# Altium schematic sheet MAIN_SCHEMATIC.SchDoc
size A4; SheetNumber: 1; SheetTotal: 9
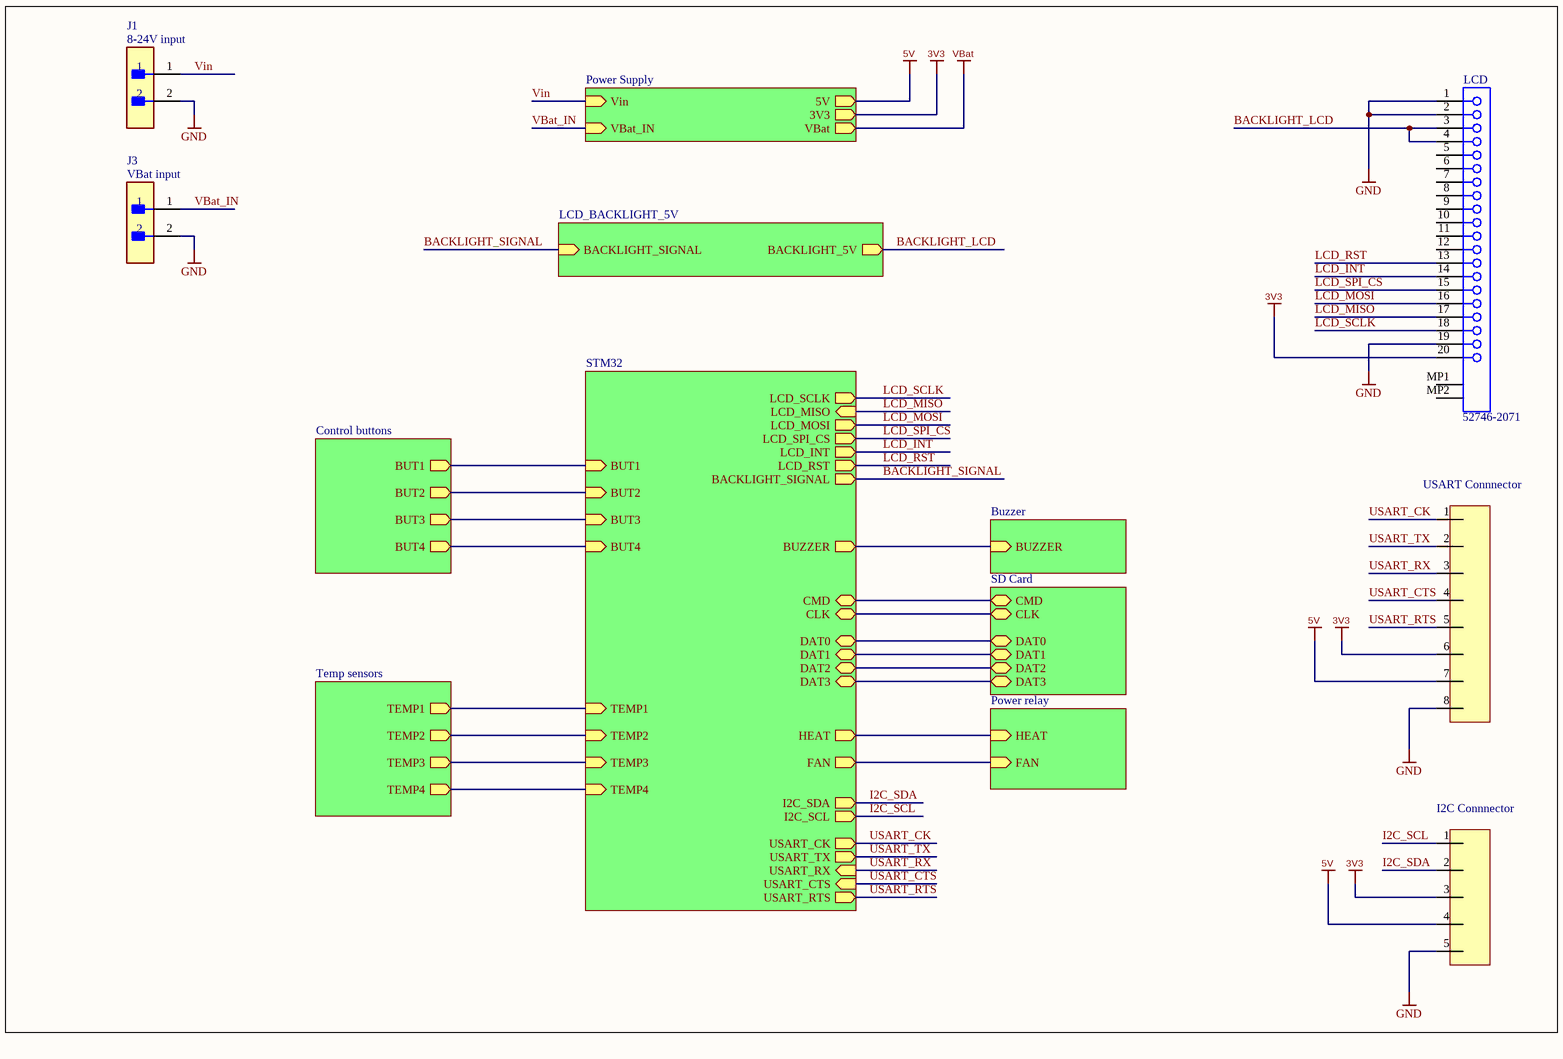
[diagram p0: MAIN_SCHEMATIC.SchDoc]

## Parts
J1  B2B-XH-A(LF)(SN)  [FP-B2B-XH-A_LF_SN-MFG]  (value not drawn)
J2  52746-2071  [MOLX-52746-2071]
J3  B2B-XH-A(LF)(SN)  [FP-B2B-XH-A_LF_SN-MFG]  (value not drawn)
J4  NSL254M-8G  [NSL254M-8G]  (value not drawn)
J5  NSL254M-5G  [NSL254M-5G]  (value not drawn)

## Sub-sheets
Buzzer = BUZZER.SchDoc: BUZZER (in)
Control buttons = BUTTONS.SchDoc: BUT1 (out), BUT2 (out), BUT3 (out), BUT4 (out)
LCD_BACKLIGHT_5V = 3V3_5V_LEVEL_SHIFTER.SchDoc: BACKLIGHT_SIGNAL (in), BACKLIGHT_5V (out)
Power relay = SR40A.SchDoc: HEAT (in), FAN (in)
Power Supply = POWER_SUPPLY.SchDoc: Vin (in), 5V (out), 3V3 (out), VBat (out), VBat_IN (in)
SD Card = SD_CARD.SchDoc: CMD (bidir), CLK (bidir), DAT0 (bidir), DAT1 (bidir), DAT2 (bidir), DAT3 (bidir)
STM32 = STM32: BUT1 (in), BUT2 (in), BUT3 (in), BUT4 (in), TEMP1 (in), TEMP2 (in), TEMP3 (in), TEMP4 (in), HEAT (out), FAN (out), CMD (bidir), CLK (bidir), DAT0 (bidir), DAT1 (bidir), DAT2 (bidir), DAT3 (bidir), BUZZER (out), LCD_SCLK (out), LCD_MISO (in), LCD_MOSI (out), LCD_SPI_CS (out), LCD_INT (out), LCD_RST (out), BACKLIGHT_SIGNAL (out), I2C_SDA (out), I2C_SCL (out), USART_CK (out), USART_TX (out), USART_RX (in), USART_RTS (out), USART_CTS (in)
Temp sensors = PT1000.SchDoc: TEMP1 (out), TEMP2 (out), TEMP3 (out), TEMP4 (out)

## Nets
3V3: J2.20 J4.6 J5.3 ; sheet Power Supply/3V3
5V: J4.7 J5.4 ; sheet Power Supply/5V
GND: J1.2 J2.1 J2.2 J2.19 J3.2 J4.8 J5.5
VBat: sheet Power Supply/VBat
BACKLIGHT_LCD: J2.3 J2.4 ; sheet LCD_BACKLIGHT_5V/BACKLIGHT_5V
BACKLIGHT_SIGNAL: sheet STM32/BACKLIGHT_SIGNAL, sheet LCD_BACKLIGHT_5V/BACKLIGHT_SIGNAL
I2C_SCL: J5.1 ; sheet STM32/I2C_SCL
I2C_SDA: J5.2 ; sheet STM32/I2C_SDA
LCD_INT: J2.14 ; sheet STM32/LCD_INT
LCD_MISO: J2.17 ; sheet STM32/LCD_MISO
LCD_MOSI: J2.16 ; sheet STM32/LCD_MOSI
LCD_RST: J2.13 ; sheet STM32/LCD_RST
LCD_SCLK: J2.18 ; sheet STM32/LCD_SCLK
LCD_SPI_CS: J2.15 ; sheet STM32/LCD_SPI_CS
USART_CK: J4.1 ; sheet STM32/USART_CK
USART_CTS: J4.4 ; sheet STM32/USART_CTS
USART_RTS: J4.5 ; sheet STM32/USART_RTS
USART_RX: J4.3 ; sheet STM32/USART_RX
USART_TX: J4.2 ; sheet STM32/USART_TX
VBat_IN: J3.1 ; sheet Power Supply/VBat_IN
Vin: J1.1 ; sheet Power Supply/Vin
(unnamed): sheet STM32/BUT1, sheet Control buttons/BUT1
(unnamed): sheet STM32/BUT2, sheet Control buttons/BUT2
(unnamed): sheet STM32/BUT3, sheet Control buttons/BUT3
(unnamed): sheet STM32/BUT4, sheet Control buttons/BUT4
(unnamed): sheet STM32/TEMP1, sheet Temp sensors/TEMP1
(unnamed): sheet STM32/TEMP2, sheet Temp sensors/TEMP2
(unnamed): sheet STM32/TEMP3, sheet Temp sensors/TEMP3
(unnamed): sheet STM32/TEMP4, sheet Temp sensors/TEMP4
(unnamed): sheet STM32/HEAT, sheet Power relay/HEAT
(unnamed): sheet STM32/FAN, sheet Power relay/FAN
(unnamed): sheet STM32/CMD, sheet SD Card/CMD
(unnamed): sheet STM32/CLK, sheet SD Card/CLK
(unnamed): sheet STM32/DAT0, sheet SD Card/DAT0
(unnamed): sheet STM32/DAT1, sheet SD Card/DAT1
(unnamed): sheet STM32/DAT2, sheet SD Card/DAT2
(unnamed): sheet STM32/DAT3, sheet SD Card/DAT3
(unnamed): sheet STM32/BUZZER, sheet Buzzer/BUZZER

Not connected (* = marked no-connect by the designer): J2 5 6 7 8 9 10 11 12 MP1 MP2

## Notes on the sheet
- (near J1) 8-24V input
- (near J2) LCD
- (near J3) VBat input
- (near J4) USART Connnector
- (near J5) I2C Connnector

## Library data of the parts
J1 J3 = CMP-2000-05888-3: CONN HEADER VERT 2POS 2.5MM; Current Rating: 3A; Voltage Rating: 250V; Number of Contacts: 2; Contact Resistance: 20mR; Wire/Cable Gauge: 22AWG; Insulation Resistance: 1GR; Connector Type: Male Pin; Packaging: Bulk; Contact Material: Brass; Lead Free: Lead Free; Orientation: Straight; Contact Plating: Tin; Max Current Rating: 3A; Termination: Solder; Fastening Type: Detent; Depth: 5.75mm; Housing Material: Polyamide; REACH SVHC: No SVHC; Series: XH; Voltage Rating (AC): 250V; Number of Positions: 2; Color: Natural; Contact Type: Male Pin; Max Voltage Rating (DC): 250V; Pitch: 2.5mm; Lead Pitch: 2.5mm; Mount: Through Hole; Max Operating Temperature: 85°C; Length: 7.4mm; Max Voltage Rating (AC): 250V; Min Operating Temperature: -25°C; Number of Rows: 1; Housing Color: White
J2 = CMP-1241-00382-1: 0.5 mm Pitch Easy-On(TM) Type FPC Connector, 2.0 mm Mated Height, Right Angle, ZIF, SMT, Bottom Contact, 20 Circuits, -20 to 85 degC, ELV and RoHS Compliant, Tape and Reel; Manufacturer: Molex; PCB Retention: Yes; Stackable: No; Pitch - Mating Interface: 0.50mm; Mated Height: 2.00mm; Entry Angle: 90degrees Angle; Material - Plating Mating: Gold; Current (Max per Contact): 0.5A; Durability (mating cycles max): 20; Material - Metal: Phosphor Bronze; Voltage (Max): 50V; ComponentLink1Description: Manufacturer URL; Polarized to PCB: Yes; Orientation: Right Angle; Contact Position: Bottom; ComponentLink2Description: Datasheet; PackageDescription: 20-Lead FPC Connector, Pitch 0.5 mm; Packing: Tape and Reel; PackageReference: 52746-2071; ComponentLink3Description: Package Specification; Material - Plating Termination: Gold; PackageVersion: Rev. H, 05/2009; ComponentLink2URL: http://www.molex.com/webdocs/datasheets/pdf/en-us/0527462071_FFC_FPC_CONNECTORS.pdf; Circuits (Loaded): 20; ComponentLink3URL: http://www.molex.com/pdm_docs/sd/527462071_sd.pdf; Mounting Technology: Surface Mount; PartNumber: 52746-2071; RoHS: TRUE; ComponentLink1URL: http://www.molex.com/molex/index.jsp; PCB Locator: No; Number of Rows: 1
J4 = NSL254M-8G: 7pin, 2.54mm THT connector
J5 = NSL254M-5G: 5pin, 2.54mm THT connector